# EasyEDA Pro project C8T6v1.eprj, schematic Schematic4
Board Name: Board3; Create Date: 2026-11-06; Page Name: P1; Project Name: 12; Schematic Name: Schematic4; Update Date: 2026-11-06; Company: 嘉立创EDA; Page Size: A4; Version: V1.0
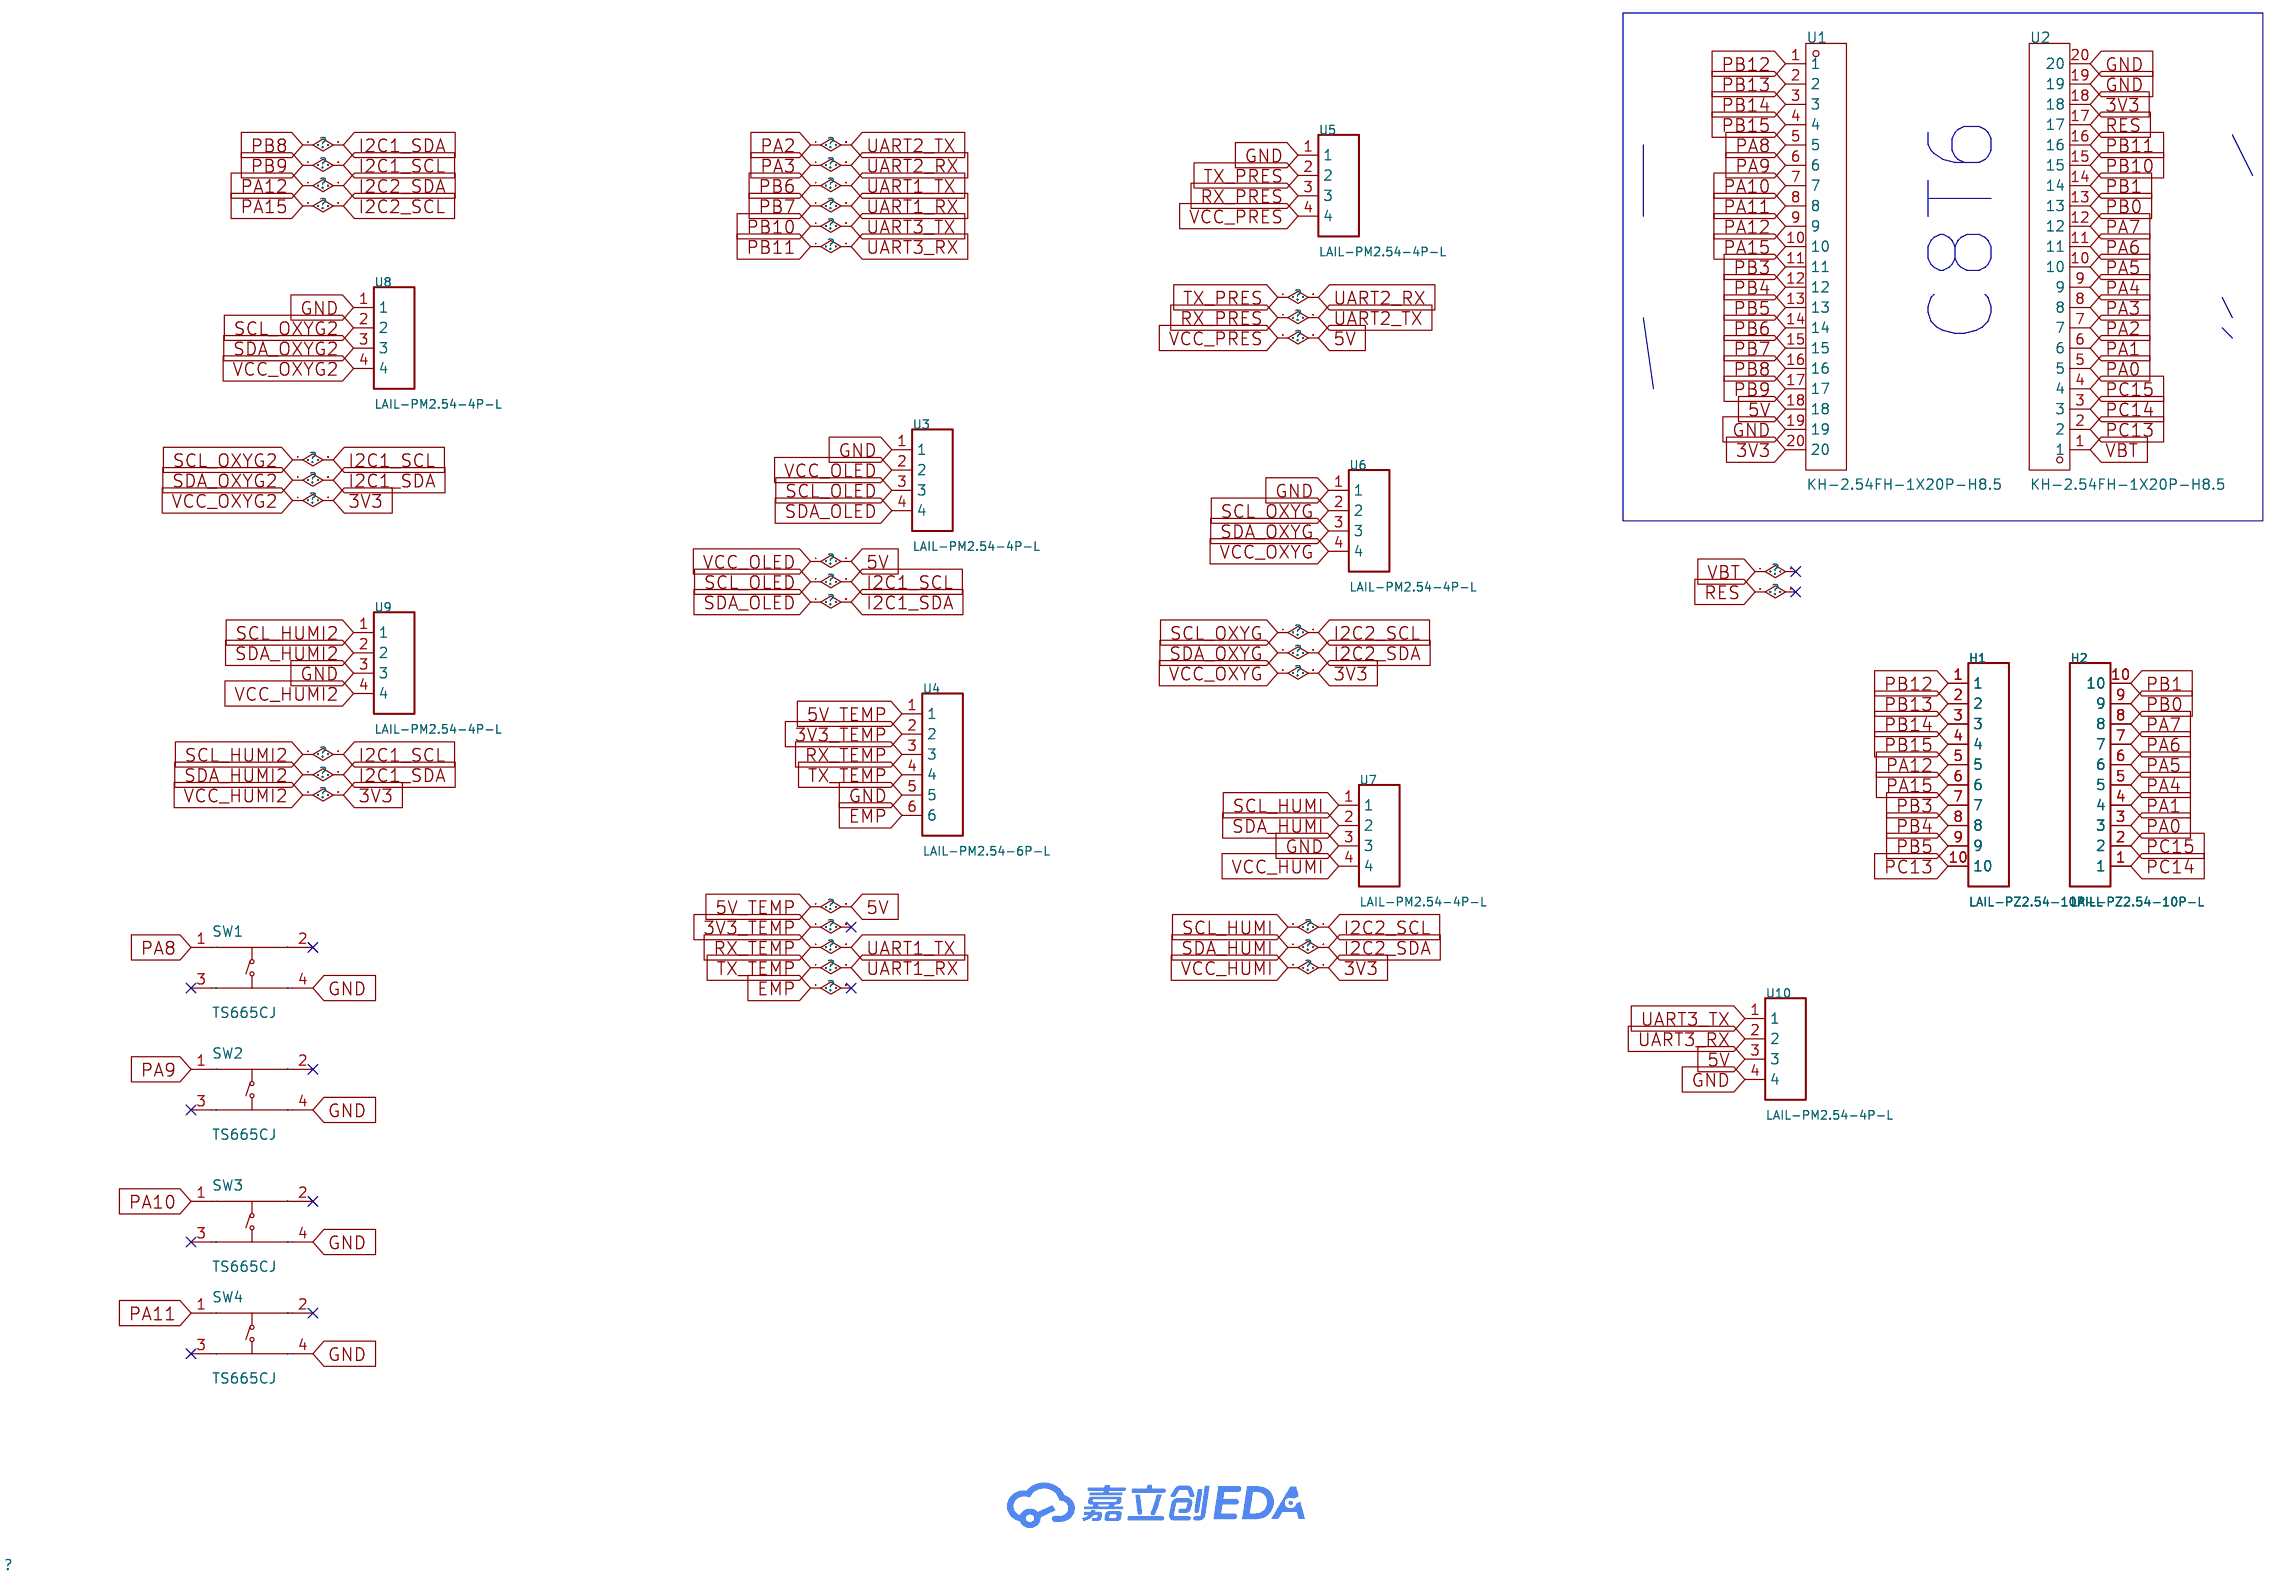
[diagram p3: schematic sheet]

## Parts
H1  LAIL-PZ2.54-10P-L  [CONN-TH_LAIL-PZ2.54-10P-L]
H2  LAIL-PZ2.54-10P-L  [CONN-TH_LAIL-PZ2.54-10P-L]
SW1  TS665CJ  [SW-TH_4P-L6.0-W6.0-P4.50-LS6.5]
SW2  TS665CJ  [SW-TH_4P-L6.0-W6.0-P4.50-LS6.5]
SW3  TS665CJ  [SW-TH_4P-L6.0-W6.0-P4.50-LS6.5]
SW4  TS665CJ  [SW-TH_4P-L6.0-W6.0-P4.50-LS6.5]
U1  KH-2.54FH-1X20P-H8.5  [HDR-TH_20P-P2.54-V-F-2]
U2  KH-2.54FH-1X20P-H8.5  [HDR-TH_20P-P2.54-V-F-2]
U3  LAIL-PM2.54-4P-L  [HDR-TH_4P-P2.54-V-F]
U4  LAIL-PM2.54-6P-L  [HDR-TH_LAIL-PM2.54-6P-L]
U5  LAIL-PM2.54-4P-L  [HDR-TH_4P-P2.54-V-F]
U6  LAIL-PM2.54-4P-L  [HDR-TH_4P-P2.54-V-F]
U7  LAIL-PM2.54-4P-L  [HDR-TH_4P-P2.54-V-F]
U8  LAIL-PM2.54-4P-L  [HDR-TH_4P-P2.54-V-F]
U9  LAIL-PM2.54-4P-L  [HDR-TH_4P-P2.54-V-F]
U10  LAIL-PM2.54-4P-L  [HDR-TH_4P-P2.54-V-F]

## Library data of the parts
H1 H2 = LAIL-PZ2.54-10P-L: LCSC Part Name: 1x10P 间距:2.54mm 方针 直插; Supplier Part: C54950617; Manufacturer: LAILAN(莱联); Supplier Footprint: 插件,P=2.54mm; JLCPCB Part Class: 扩展库; Datasheet: https://item.szlcsc.com/datasheet/LAIL-PZ2.54-10P-L/58519970.html; Supplier: LCSC; Pin Structure: 1x10P; Pitch: 2.54mm; Circluar Pins/Square Pins: 方针; Mounting Type: 直插; Number of Rows: 单排; Number of Pins: 10P; Current Rating: 3A; Voltage Rating (Max): 250V; Length of Mating Pin: 6mm; Insulation Height: 2.5mm; Length of End Connection Pin: 3mm; Contact Material: 黄铜; Contact Plating: 金; Operating Temperature: -25℃~+80℃; Color: 黑色
SW1-SW4 = TS665CJ: LCSC Part Name: 6*6*5mm 直插 轻触开关; Supplier Part: C393938; Manufacturer: SHOU HAN(首韩); Supplier Footprint: 插件-4P,6x6mm; JLCPCB Part Class: 扩展库; Datasheet: https://item.szlcsc.com/datasheet/TS665CJ/372550.html; Supplier: LCSC; Circuit: 单刀单掷; Actuator Style: 圆形按钮; Operating Force: 2.5N; Mounting Type: 直插; Length: 6mm; Width: 6mm; Switch Height: 5mm; with Bracket: 不带支架; Contact Current: 50mA; Voltage Rating: 12V; Actuator/Cap Color: 黑色; With Lamp: 无; Termination Style: PC引脚; Life: 5万次; Operating Temperature: -25℃~+70℃
U1 U2 = KH-2.54FH-1X20P-H8.5: LCSC Part Name: 1x20P 间距:2.54mm 直插; Supplier Part: C2905423; Manufacturer: kinghelm(金航标); Supplier Footprint: 插件,P=2.54mm; JLCPCB Part Class: 扩展库; Datasheet: https://item.szlcsc.com/datasheet/KH-2.54FH-1X20P-H8.5/3175197.html; Supplier: LCSC; Holes Structure: 1x20P; Pitch: 2.54mm; Circular Hole / Square Hole: 方孔; Mounting Type: 直插; Number of Rows: 单排; Number of Positions: 20P; Current Rating: 3A; Holes Direction: 顶部; Insulation Height: 8.5mm; Contact Material: 黄铜; Contact Plating: 金; Operating Temperature: -40℃~+105℃; PIN Length: 3mm
U3 U5-U10 = LAIL-PM2.54-4P-L: LCSC Part Name: 1x4P 间距:2.54mm 直插; Supplier Part: C54973823; Manufacturer: LAILAN(莱联); Supplier Footprint: 插件,P=2.54mm; JLCPCB Part Class: 扩展库; Datasheet: https://item.szlcsc.com/datasheet/LAIL-PM2.54-4P-L/58554901.html; Supplier: LCSC; Holes Structure: 1x4P; Pitch: 2.54mm; Circular Hole / Square Hole: 方孔; Mounting Type: 直插; Number of Rows: 单排; Number of Positions: 4P; Current Rating: 3A; Voltage Rating (Max): 250V; Holes Direction: 顶部; Insulation Height: 8.5mm; Contact Material: 黄铜; Contact Plating: 金; Operating Temperature: -25℃~+80℃; PIN Length: 3mm
U4 = LAIL-PM2.54-6P-L: LCSC Part Name: 1x6P 间距:2.54mm 直插; Supplier Part: C54973826; Manufacturer: LAILAN(莱联); Supplier Footprint: 插件,P=2.54mm; JLCPCB Part Class: 扩展库; Datasheet: https://item.szlcsc.com/datasheet/LAIL-PM2.54-6P-L/58554904.html; Supplier: LCSC; Holes Structure: 1x6P; Pitch: 2.54mm; Circular Hole / Square Hole: 方孔; Mounting Type: 直插; Number of Rows: 单排; Number of Positions: 6P; Current Rating: 3A; Voltage Rating (Max): 250V; Holes Direction: 顶部; Insulation Height: 8.5mm; Contact Material: 黄铜; Contact Plating: 金; Operating Temperature: -25℃~+80℃; PIN Length: 3mm

## Nets
3V3: U1.20 U2.18 U6.4 U7.4 U8.4 U9.4
3V3_TEMP: U4.2
5V: U1.18 U3.2 U4.1 U5.4 U10.3
GND: SW1.4(D) SW2.4(D) SW3.4(D) SW4.4(D) U1.19 U2.19 U2.20 U3.1 U4.5 U5.1 U6.1 U7.3 U8.1 U9.3 U10.4
EMP: U4.6
I2C1_SCL: U1.17 U3.3 U8.2 U9.1
I2C1_SDA: U1.16 U3.4 U8.3 U9.2
I2C2_SCL: H1.6 U1.10 U6.2 U7.1
I2C2_SDA: H1.5 U1.9 U6.3 U7.2
PA0: H2.3 U2.5
PA1: H2.4 U2.6
PA2: U2.7 U5.3
PA3: U2.8 U5.2
PA4: H2.5 U2.9
PA5: H2.6 U2.10
PA6: H2.7 U2.11
PA7: H2.8 U2.12
PA8: SW1.1(A) U1.5
PA9: SW2.1(A) U1.6
PA10: SW3.1(A) U1.7
PA11: SW4.1(A) U1.8
PB0: H2.9 U2.13
PB1: H2.10 U2.14
PB3: H1.7 U1.11
PB4: H1.8 U1.12
PB5: H1.9 U1.13
PB6: U1.14 U4.3
PB7: U1.15 U4.4
PB10: U2.15 U10.1
PB11: U2.16 U10.2
PB12: H1.1 U1.1
PB13: H1.2 U1.2
PB14: H1.3 U1.3
PB15: H1.4 U1.4
PC13: H1.10 U2.2
PC14: H2.1 U2.3
PC15: H2.2 U2.4
RES: U2.17
VBT: U2.1

Not connected (* = marked no-connect by the designer): SW1 2(B)* 3(C)*; SW2 2(B)* 3(C)*; SW3 2(B)* 3(C)*; SW4 2(B)* 3(C)*

## Notes on the sheet
- C8T6
